# EasyEDA Pro project d2-afe-development.epro, board PCB1_1
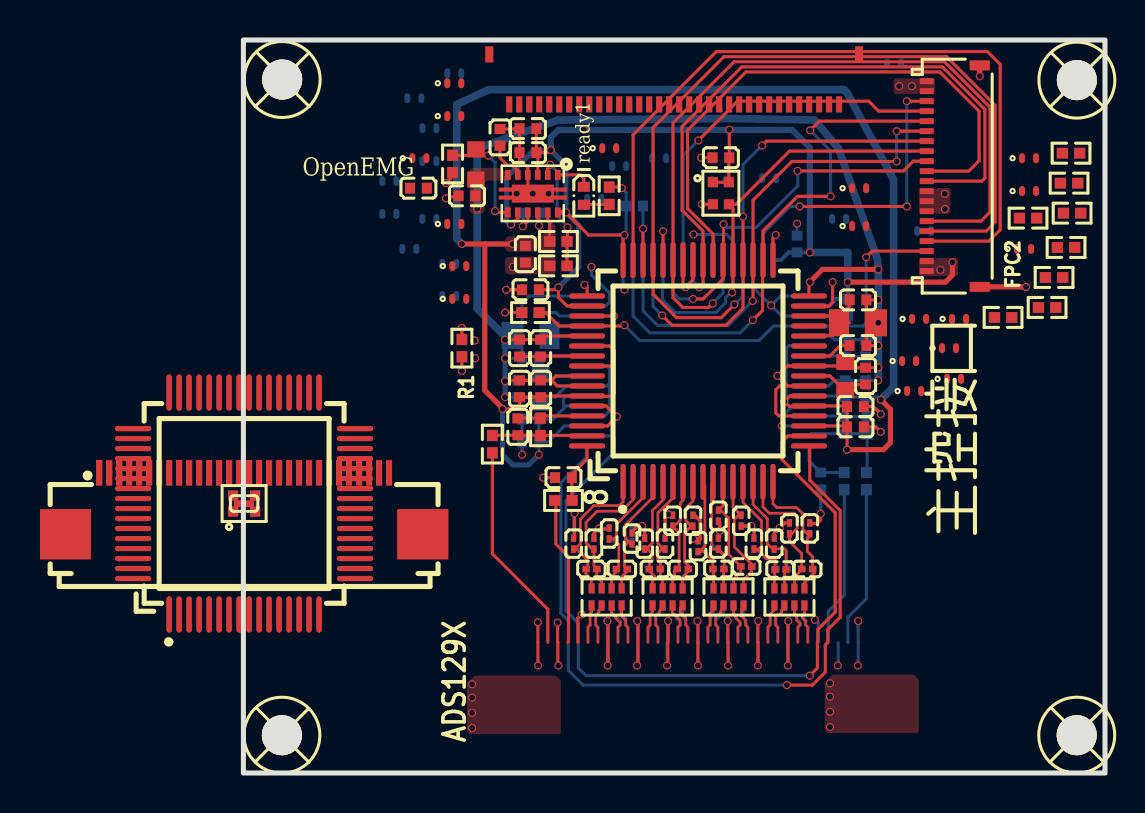
[diagram p2: board, top side]
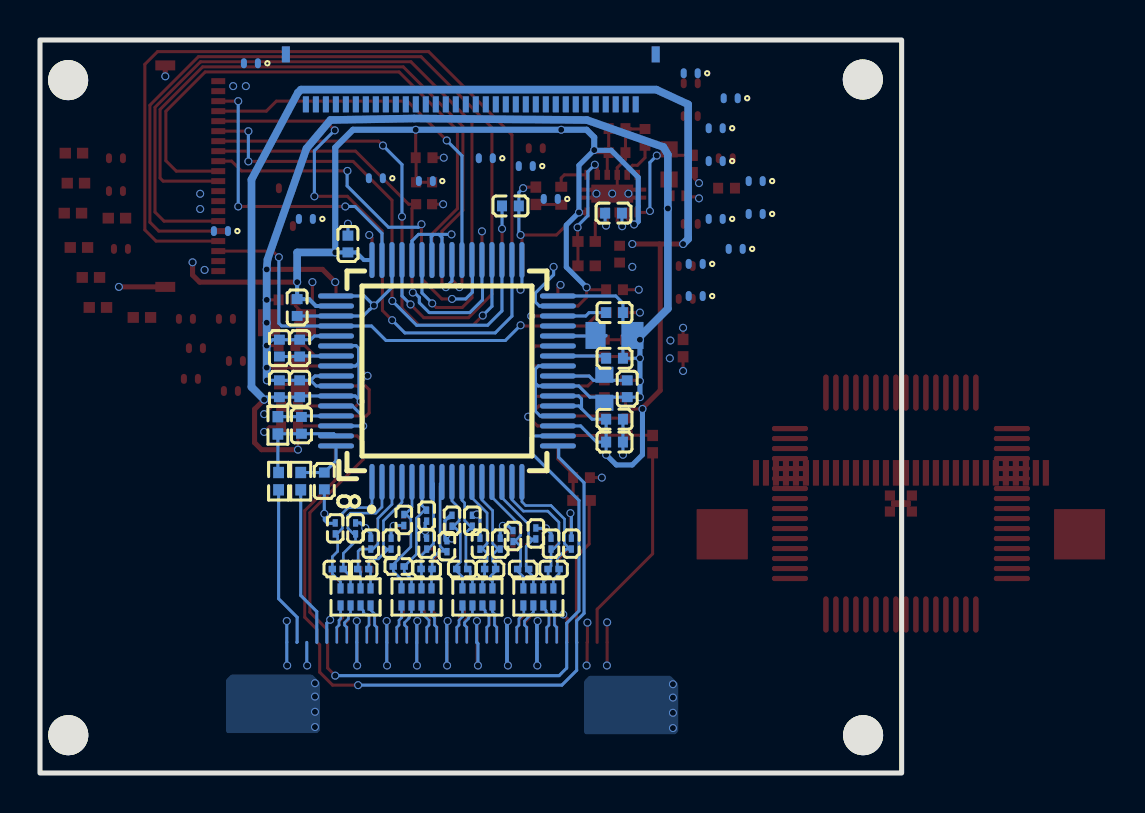
[diagram p3: board, bottom side, seen from below]

Outline 43.1 x 36.67 mm; copper layers: Top Layer, Inner1, Inner2, Bottom Layer. Coordinates in mm from the lower left corner of the outline.
Outline path: rectangle 0,36.67 43.1,0
Stack: Top Layer 0.035mm Outer layer thickness 1oz / Dielectric1 0.2104mm 7628 RC49% 8.6mil / Inner1 0.0152mm Inner layer thickness / Dielectric2 1.065mm 1.1mm H/HOZ Copper / Inner2 0.0152mm Inner layer thickness / Dielectric3 0.2104mm 7628 RC49% 8.6mil / Bottom Layer 0.035mm Outer layer thickness 1oz

## Design rules (mm)
net IN8N: DP1
net IN8P: DP1
net IN7N: DP2
net IN7P: DP2
net IN6N: DP3
net IN6P: DP3
net IN5N: DP4
net IN5P: DP4
net IN4N: DP5
net IN4P: DP5
net IN3N: DP6
net IN3P: DP6
net IN2P: DP7
net IN2N: DP7
net IN1N: DP8
net IN1P: DP8
net IN1P2: DP35
net IN1N2: DP35
net IN2P2: DP37
net IN2N2: DP37
net IN3P2: DP33
net IN3N2: DP33
net IN4P2: DP31
net IN4N2: DP31
net IN5P2: DP29
net IN5N2: DP29
net IN6P2: DP27
net IN6N2: DP27
net IN7P2: DP25
net IN7N2: DP25
net IN8P2: DP23
net IN8N2: DP23
spacing copperThickness1oz (default): track to track 0.102, other pairs 0.152 to 0.3
spacing copperThickness2oz: track to track 0.203, other pairs 0.152 to 0.3
spacing Copper_copperRegion: track to track 0.102, other pairs 0.152 to 0.3
spacing Plane_innerPlane: track to track 0.102, other pairs 0.152 to 0.3
track width copperThickness1oz (default): min 0.127, default 0.152, max 2.54
track width copperThickness2oz: min 0.203, default 0.254, max 2.54
differential pair differentialPair (default): width min 0.127, default 0.127, max 2.54; gap min 0.152, default 0.152
net +3.3V uses copperRegion_copperThickness1oz
net AGND uses copperRegion_copperThickness1oz
net -2.5V uses copperRegion_copperThickness1oz
net +2.5V uses copperRegion_copperThickness1oz
net GND uses copperRegion_copperThickness1oz
pour e1164 uses Copper_copperRegion, copperRegion_Copper_copperRegion
pour e1166 uses Copper_copperRegion, copperRegion_Copper_copperRegion
pour e1169 uses Copper_copperRegion, copperRegion_Copper_copperRegion
pour e1171 uses Copper_copperRegion, copperRegion_Copper_copperRegion
pour e1173 uses Copper_copperRegion, copperRegion_Copper_copperRegion
pour e1175 uses Copper_copperRegion, copperRegion_Copper_copperRegion
pour e1177 uses Copper_copperRegion, copperRegion_Copper_copperRegion
pour e1179 uses Copper_copperRegion, copperRegion_Copper_copperRegion
pour e1181 uses Copper_copperRegion, copperRegion_Copper_copperRegion
region e1678 uses Copper_copperRegion, copperRegion_Copper_copperRegion
pour e1686 uses Copper_copperRegion, copperRegion_Copper_copperRegion
pour e1905 uses Copper_copperRegion, copperRegion_Copper_copperRegion
pour e1908 uses Copper_copperRegion, copperRegion_Copper_copperRegion
pour e1930 uses Copper_copperRegion, copperRegion_Copper_copperRegion

## Placement (name value [footprint] x y rotation side)
C1  22uF  [C08A:V4_C54]  30.74 22.52 0 top
C2  22uF  [C08A:V4_C54]  14.36 21.89 180 bottom
C3  100nF  [C0402]  31.12 19.86 270 top
C4  10uF  [C08A:V4_C46]  30.11 19.86 270 top
C5  100nF  [C0402]  13.73 19.22 90 bottom
C6  2.2uF  [C0402]  14.11 25.95 270 top
C7  2.2uF  [C0402]  11.19 28.87 180 top
C8  100nF  [C0402]  14.23 32.23 0 top
C9  10uF  [C0402]  14.23 31.03 180 top
C10  100nF  [C0402]  14.41 28 180 bottom
C11  4.7uF  [C0402]  12.84 31.79 270 top
C12  1uF  [C0402]  30.74 21.38 0 top
C13  1uF  [C0402]  30.74 23.67 0 top
C14  10nF  [C0402]  13.73 17.32 270 top
C15  1uF  [C0402]  14.36 20.75 180 bottom
C16  1uF  [C0402]  14.36 23.03 180 bottom
C17  10nF  [C0402]  30.02 17.39 270 bottom
C18  100nF  [C0402]  30.11 21.25 270 bottom
C19  1uF  [C0402]  31.12 21.25 270 bottom
C20  1uF  [C0402]  13.81 21.25 270 top
C21  100nF  [C0402]  14.87 21.25 270 top
C22  100nF  [C0402]  14.36 24.17 180 top
C23  1uF  [C0402]  19.57 28.36 0 bottom
C24  100nF  [C0402]  30.62 17.32 0 top
C25  1uF  [C0402]  30.62 18.33 0 top
C26  100nF  [C0402]  14.87 19.22 90 top
C27  1uF  [C0402]  13.81 19.22 90 top
C28  100nF  [C0402]  27.7 26.46 90 bottom
C29  1uF  [C0402]  30.24 23.28 270 bottom
C30  100nF  [C0402]  14.36 16.55 180 bottom
C31  1uF  [C0402]  14.36 17.7 180 bottom
C32  100nF  [C0402]  30.11 19.22 90 bottom
C33  1uF  [C0402]  31.12 19.22 90 bottom
C34  10uF  [C08A:V4_C46]  14.87 19.22 90 bottom
C37  100nF  [C0402]  23.89 30.78 0 top
C55  470pF  [C0201]  28.33 12.24 270 top
C57  470pF  [C0201]  27.31 12.24 270 top
C58  470pF  [C0201]  26.55 11.47 270 top
C59  470pF  [C0201]  25.54 11.47 270 top
C60  470pF  [C0201]  24.9 12.62 90 top
C61  470pF  [C0201]  23.76 12.87 90 top
C62  470pF  [C0201]  23.76 11.47 270 top
C63  470pF  [C0201]  22.74 11.35 270 top
C64  470pF  [C0201]  22.49 12.62 270 top
C65  470pF  [C0201]  21.47 12.62 270 top
C66  470pF  [C0201]  21.09 11.47 270 top
C67  470pF  [C0201]  20.08 11.47 270 top
C68  470pF  [C0201]  19.44 11.73 270 top
C69  470pF  [C0201]  18.3 11.98 270 top
C70  470pF  [C0201]  17.54 11.47 270 top
C71  470pF  [C0201]  16.52 11.47 270 top
C72  100pF  [C0201#2]  28.2 10.2 0 top
C73  100pF  [C0201#2]  26.87 10.18 0 top
C74  100pF  [C0201#2]  25.16 10.33 0 top
C75  100pF  [C0201#2]  23.76 10.2 0 top
C76  100pF  [C0201#2]  21.98 10.2 0 top
C77  100pF  [C0201#2]  20.58 10.2 0 top
C78  100pF  [C0201#2]  18.93 10.2 0 top
C79  100pF  [C0201#2]  17.41 10.2 0 top
C93  470pF  [C0201]  16.52 11.47 270 bottom
C94  470pF  [C0201]  17.54 11.47 270 bottom
C95  470pF  [C0201]  18.3 11.98 270 bottom
C96  470pF  [C0201]  19.44 11.86 270 bottom
C97  470pF  [C0201]  20.08 11.47 270 bottom
C98  470pF  [C0201]  21.09 11.47 270 bottom
C99  470pF  [C0201]  21.47 12.62 270 bottom
C100  470pF  [C0201]  22.49 12.62 270 bottom
C101  470pF  [C0201]  22.74 11.35 270 bottom
C102  470pF  [C0201]  23.76 11.47 270 bottom
C103  470pF  [C0201]  23.76 12.87 90 bottom
C104  470pF  [C0201]  24.9 12.66 90 bottom
C105  470pF  [C0201]  25.54 11.47 270 bottom
C106  470pF  [C0201]  26.55 11.47 270 bottom
C107  470pF  [C0201]  27.31 12.24 270 bottom
C108  470pF  [C0201]  28.33 12.24 270 bottom
C109  100pF  [C0201#2]  17.41 10.2 180 bottom
C110  100pF  [C0201#2]  18.93 10.2 180 bottom
C111  100pF  [C0201#2]  20.58 10.2 180 bottom
C112  100pF  [C0201#2]  21.98 10.2 180 bottom
C113  100pF  [C0201#2]  23.76 10.2 180 bottom
C114  100pF  [C0201#2]  25.16 10.33 180 bottom
C115  100pF  [C0201#2]  26.93 10.2 180 bottom
C116  100pF  [C0201#2]  28.2 10.2 180 bottom
C123  100pF  [C0402]  16.01 14.78 180 top
C124  100pF  [C0402]  28.88 14.61 270 bottom
C138  100nF  [C0402]  8.76 29.26 0 top
D910  ESD401DPYR  [C08A:D910]  18.3 31.25 0 top
D911  ESD401DPYR  [C08A:D910]  10.55 32.86 0 top
D912  ESD401DPYR  [C08A:D910]  10.55 27.47 0 top
D913  ESD401DPYR  [C08A:D910]  10.55 34.5 0 top
D914  ESD401DPYR  [C08A:D910]  10.8 25.36 0 top
D915  ESD401DPYR  [C08A:D910]  10.8 23.72 0 top
D916  ESD401DPYR  [C08A:D910]  30.8 29.25 0 top
D917  ESD401DPYR  [C08A:D910]  30.8 27.36 0 top
D918  ESD401DPYR  [C08A:D910]  33.8 22.72 0 top
D919  ESD401DPYR  [C08A:D910]  8.8 30.75 0 top
D920  ESD401DPYR  [C08A:D910]  33.3 20.61 0 top
D921  ESD401DPYR  [C08A:D910]  35.8 22.72 0 top
D922  ESD401DPYR  [C08A:D910]  35.3 21.25 0 top
D923  ESD401DPYR  [C08A:D910]  33.55 19.11 0 top
D924  ESD401DPYR  [C08A:D910]  35.55 19.72 0 top
D925  ESD401DPYR  [C08A:D910]  39.3 30.75 0 top
D926  ESD401DPYR  [C08A:D910]  39.3 29.11 0 top
D927  ESD401DPYR  [C08A:D910]  39.05 26.22 0 top
D930  ESD401DPYR  [C08A:D910]  26.3 29.75 0 bottom
D931  ESD401DPYR  [C08A:D910]  23.8 29.61 0 bottom
D932  ESD401DPYR  [C08A:D910]  29.8 27.72 0 bottom
D933  ESD401DPYR  [C08A:D910]  20.8 30.75 0 bottom
D934  ESD401DPYR  [C08A:D910]  18.8 30.36 0 bottom
D935  ESD401DPYR  [C08A:D910]  17.55 28.72 0 bottom
D936  ESD401DPYR  [C08A:D910]  32.55 35.5 0 bottom
D937  ESD401DPYR  [C08A:D910]  34.05 27.11 0 bottom
D938  ESD401DPYR  [C08A:D910]  10.3 25.47 0 bottom
D939  ESD401DPYR  [C08A:D910]  10.55 35 0 bottom
D940  ESD401DPYR  [C08A:D910]  9.3 30.61 0 bottom
D941  ESD401DPYR  [C08A:D910]  9.3 27.72 0 bottom
D942  ESD401DPYR  [C08A:D910]  9.3 32.25 0 bottom
D943  ESD401DPYR  [C08A:D910]  10.3 23.86 0 bottom
D944  ESD401DPYR  [C08A:D910]  8.3 26.22 0 bottom
D945  ESD401DPYR  [C08A:D910]  8.55 33.75 0 bottom
D946  ESD401DPYR  [C08A:D910]  7.3 29.61 0 bottom
D947  ESD401DPYR  [C08A:D910]  7.3 27.97 0 bottom
FPC1  FH34SRJ-34S-0.5SH(50)  [Hirose_FH34SRJ-34S-0.5SH]  21.55 33.45 180 top
FPC2  5034802000  [FPC-SMD_5034802000]  35.51 29.86 90 top
FPC3  FH34SRJ-34S-0.5SH(50)  [Hirose_FH34SRJ-34S-0.5SH]  21.55 33.45 0 bottom
LM1  LM27762DSSR  [WSON-12_L3.0-W2.0-P0.50-BL-EP]  14.48 28.98 180 top
NOREF  -  [Pad_e71]  -1.21 15.02 0 top
NOREF#2  -  [Pad_e53]  -8.9 11.94 0 top
NOREF#3  -  [Pad_e196]  5.59 9.73 0 top
NOREF#4  -  [Pad_e22]  -0.24 13.48 0 top
NOREF#5  -  [Pad_e21]  0.31 13.48 0 top
NOREF#6  -  [Pad_e78]  -4.71 15.02 0 top
NOREF#7  -  [Pad_e188]  5.59 13.73 0 top
NOREF#8  -  [Pad_e183]  5.59 16.23 0 top
NOREF#9  -  [Pad_e209]  -2.21 7.93 0 top
NOREF#10  -  [Pad_e59]  4.79 15.02 0 top
NOREF#11  -  [Pad_e194]  5.59 10.73 0 top
NOREF#12  -  [Pad_e170]  -1.21 19.03 0 top
NOREF#13  -  [Pad_e176]  1.79 19.03 0 top
NOREF#14  -  [Pad_e21]  0.31 13.48 0 top
NOREF#15  -  [Pad_e67]  0.79 15.02 0 top
NOREF#16  -  [Pad_e16]  0.59 13.08 0 top
NOREF#17  -  [Pad_e66]  1.29 15.02 0 top
NOREF#18  -  [Pad_e174]  0.79 19.03 0 top
NOREF#19  -  [Pad_e202]  1.29 7.93 0 top
NOREF#20  -  [Pad_e201]  1.79 7.93 0 top
NOREF#21  -  [Pad_e208]  -1.71 7.93 0 top
NOREF#22  -  [Pad_e82]  -6.71 15.02 0 top
NOREF#23  -  [Pad_e22]  -0.24 13.48 0 top
NOREF#24  -  [Pad_e21]  0.31 13.48 0 top
NOREF#25  -  [Pad_e22]  -0.24 13.48 0 top
NOREF#26  -  [Pad_e21]  0.31 13.48 0 top
NOREF#27  -  [Pad_e68]  0.29 15.02 0 top
NOREF#28  -  [Pad_e193]  5.59 11.23 0 top
NOREF#29  -  [Pad_e17]  0.59 13.88 0 top
NOREF#30  -  [Pad_e21]  0.31 13.48 0 top
NOREF#31  -  [Pad_e22]  -0.24 13.48 0 top
NOREF#32  -  [Pad_e159]  -5.51 14.73 0 top
NOREF#33  -  [Pad_e203]  0.79 7.93 0 top
NOREF#34  -  [Pad_e22]  -0.24 13.48 0 top
NOREF#35  -  [Pad_e21]  0.31 13.48 0 top
NOREF#36  -  [Pad_e21]  0.31 13.48 0 top
NOREF#37  -  [Pad_e21]  0.31 13.48 0 top
NOREF#38  -  [Pad_e22]  -0.24 13.48 0 top
NOREF#39  -  [Pad_e152]  -5.51 11.23 0 top
NOREF#40  -  [Pad_e82]  -6.71 15.02 0 top
NOREF#41  -  [Pad_e166]  -3.21 19.03 0 top
NOREF#42  -  [Pad_e22]  -0.24 13.48 0 top
NOREF#43  -  [Pad_e190]  5.59 12.73 0 top
NOREF#44  -  [Pad_e22]  -0.24 13.48 0 top
NOREF#45  -  [Pad_e180]  3.79 19.03 0 top
NOREF#46  -  [Pad_e22]  -0.24 13.48 0 top
NOREF#47  -  [Pad_e197]  3.79 7.93 0 top
NOREF#48  -  [Pad_e78]  -4.71 15.02 0 top
NOREF#49  -  [Pad_e175]  1.29 19.03 0 top
NOREF#50  -  [Pad_e180]  3.79 19.03 0 top
NOREF#51  -  [Pad_e21]  0.31 13.48 0 top
NOREF#52  -  [Pad_e187]  5.59 14.23 0 top
NOREF#53  -  [Pad_e149]  -5.51 9.73 0 top
NOREF#54  -  [Pad_e191]  5.59 12.23 0 top
NOREF#55  -  [Pad_e166]  -3.21 19.03 0 top
NOREF#56  -  [Pad_e59]  4.79 15.02 0 top
NOREF#57  -  [Pad_e21]  0.31 13.48 0 top
NOREF#58  -  [Pad_e184]  5.59 15.73 0 top
NOREF#59  -  [Pad_e21]  0.31 13.48 0 top
NOREF#60  -  [Pad_e75]  -3.21 15.02 0 top
NOREF#61  -  [Pad_e74]  -2.71 15.02 0 top
NOREF#62  -  [Pad_e212]  -3.71 7.93 0 top
NOREF#63  -  [Pad_e190]  5.59 12.73 0 top
NOREF#64  -  [Pad_e205]  -0.21 7.93 0 top
NOREF#65  -  [Pad_e177]  2.29 19.03 0 top
NOREF#66  -  [Pad_e22]  -0.24 13.48 0 top
NOREF#67  -  [Pad_e22]  -0.24 13.48 0 top
NOREF#68  -  [Pad_e211]  -3.21 7.93 0 top
NOREF#69  -  [Pad_e18]  -0.51 13.88 0 top
NOREF#70  -  [Pad_e80]  -5.71 15.02 0 top
NOREF#71  -  [Pad_e154]  -5.51 12.23 0 top
NOREF#72  -  [Pad_e160]  -5.51 15.23 0 top
NOREF#73  -  [Pad_e156]  -5.51 13.23 0 top
NOREF#74  -  [Pad_e58]  5.29 15.02 0 top
NOREF#75  -  [Pad_e167]  -2.71 19.03 0 top
NOREF#76  -  [Pad_e54]  7.29 15.02 0 top
NOREF#77  -  [Pad_e56]  6.29 15.02 0 top
NOREF#78  -  [Pad_e152]  -5.51 11.23 0 top
NOREF#79  -  [Pad_e62]  3.29 15.02 0 top
NOREF#80  -  [Pad_e21]  0.31 13.48 0 top
NOREF#81  -  [Pad_e22]  -0.24 13.48 0 top
NOREF#82  -  [Pad_e53]  -8.9 11.94 0 top
NOREF#83  -  [Pad_e64]  2.29 15.02 0 top
NOREF#84  -  [Pad_e80]  -5.71 15.02 0 top
NOREF#85  -  [Pad_e198]  3.29 7.93 0 top
NOREF#86  -  [Pad_e22]  -0.24 13.48 0 top
NOREF#87  -  [Pad_e181]  5.59 17.23 0 top
NOREF#88  -  [Pad_e57]  5.79 15.02 0 top
NOREF#89  -  [Pad_e201]  1.79 7.93 0 top
NOREF#90  -  [Pad_e81]  -6.21 15.02 0 top
NOREF#91  -  [Pad_e21]  0.31 13.48 0 top
NOREF#92  -  [Pad_e21]  0.31 13.48 0 top
NOREF#93  -  [Pad_e189]  5.59 13.23 0 top
NOREF#94  -  [Pad_e182]  5.59 16.73 0 top
NOREF#95  -  [Pad_e192]  5.59 11.73 0 top
NOREF#96  -  [Pad_e70]  -0.71 15.02 0 top
NOREF#97  -  [Pad_e154]  -5.51 12.23 0 top
NOREF#98  -  [Pad_e22]  -0.24 13.48 0 top
NOREF#99  -  [Pad_e196]  5.59 9.73 0 top
NOREF#100  -  [Pad_e22]  -0.24 13.48 0 top
NOREF#101  -  [Pad_e75]  -3.21 15.02 0 top
NOREF#102  -  [Pad_e66]  1.29 15.02 0 top
NOREF#103  -  [Pad_e69]  -0.21 15.02 0 top
NOREF#104  -  [Pad_e171]  -0.71 19.03 0 top
NOREF#105  -  [Pad_e76]  -3.71 15.02 0 top
NOREF#106  -  [Pad_e164]  -5.51 17.23 0 top
NOREF#107  -  [Pad_e204]  0.29 7.93 0 top
NOREF#108  -  [Pad_e56]  6.29 15.02 0 top
NOREF#109  -  [Pad_e155]  -5.51 12.73 0 top
NOREF#110  -  [Pad_e22]  -0.24 13.48 0 top
NOREF#111  -  [Pad_e65]  1.79 15.02 0 top
NOREF#112  -  [Pad_e63]  2.79 15.02 0 top
NOREF#113  -  [Pad_e183]  5.59 16.23 0 top
NOREF#114  -  [Pad_e22]  -0.24 13.48 0 top
NOREF#115  -  [Pad_e21]  0.31 13.48 0 top
NOREF#116  -  [Pad_e72]  -1.71 15.02 0 top
NOREF#117  -  [Pad_e173]  0.29 19.03 0 top
NOREF#118  -  [Pad_e21]  0.31 13.48 0 top
NOREF#119  -  [Pad_e21]  0.31 13.48 0 top
NOREF#120  -  [Pad_e207]  -1.21 7.93 0 top
NOREF#121  -  [Pad_e74]  -2.71 15.02 0 top
NOREF#122  -  [Pad_e21]  0.31 13.48 0 top
NOREF#123  -  [Pad_e205]  -0.21 7.93 0 top
NOREF#124  -  [Pad_e206]  -0.71 7.93 0 top
NOREF#125  -  [Pad_e21]  0.31 13.48 0 top
NOREF#126  -  [Pad_e21]  0.31 13.48 0 top
NOREF#127  -  [Pad_e157]  -5.51 13.73 0 top
NOREF#128  -  [Pad_e149]  -5.51 9.73 0 top
NOREF#129  -  [Pad_e198]  3.29 7.93 0 top
NOREF#130  -  [Pad_e178]  2.79 19.03 0 top
NOREF#131  -  [Pad_e55]  6.79 15.02 0 top
NOREF#132  -  [Pad_e64]  2.29 15.02 0 top
NOREF#133  -  [Pad_e21]  0.31 13.48 0 top
NOREF#134  -  [Pad_e22]  -0.24 13.48 0 top
NOREF#135  -  [Pad_e157]  -5.51 13.73 0 top
NOREF#136  -  [Pad_e169]  -1.71 19.03 0 top
NOREF#137  -  [Pad_e21]  0.31 13.48 0 top
NOREF#138  -  [Pad_e55]  6.79 15.02 0 top
NOREF#139  -  [Pad_e182]  5.59 16.73 0 top
NOREF#140  -  [Pad_e212]  -3.71 7.93 0 top
NOREF#141  -  [Pad_e172]  -0.21 19.03 0 top
NOREF#142  -  [Pad_e199]  2.79 7.93 0 top
NOREF#143  -  [Pad_e155]  -5.51 12.73 0 top
NOREF#144  -  [Pad_e186]  5.59 14.73 0 top
NOREF#145  -  [Pad_e169]  -1.71 19.03 0 top
NOREF#146  -  [Pad_e203]  0.79 7.93 0 top
NOREF#147  -  [Pad_e71]  -1.21 15.02 0 top
NOREF#148  -  [Pad_e22]  -0.24 13.48 0 top
NOREF#149  -  [Pad_e185]  5.59 15.23 0 top
NOREF#150  -  [Pad_e22]  -0.24 13.48 0 top
NOREF#151  -  [Pad_e72]  -1.71 15.02 0 top
NOREF#152  -  [Pad_e21]  0.31 13.48 0 top
NOREF#153  -  [Pad_e199]  2.79 7.93 0 top
NOREF#154  -  [Pad_e162]  -5.51 16.23 0 top
NOREF#155  -  [Pad_e163]  -5.51 16.73 0 top
NOREF#156  -  [Pad_e22]  -0.24 13.48 0 top
NOREF#157  -  [Pad_e21]  0.31 13.48 0 top
NOREF#158  -  [Pad_e165]  -3.71 19.03 0 top
NOREF#159  -  [Pad_e210]  -2.71 7.93 0 top
NOREF#160  -  [Pad_e186]  5.59 14.73 0 top
NOREF#161  -  [Pad_e191]  5.59 12.23 0 top
NOREF#162  -  [Pad_e60]  4.29 15.02 0 top
NOREF#163  -  [Pad_e179]  3.29 19.03 0 top
NOREF#164  -  [Pad_e202]  1.29 7.93 0 top
NOREF#165  -  [Pad_e193]  5.59 11.23 0 top
NOREF#166  -  [Pad_e161]  -5.51 15.73 0 top
NOREF#167  -  [Pad_e22]  -0.24 13.48 0 top
NOREF#168  -  [Pad_e174]  0.79 19.03 0 top
NOREF#169  -  [Pad_e211]  -3.21 7.93 0 top
NOREF#170  -  [Pad_e168]  -2.21 19.03 0 top
NOREF#171  -  [Pad_e162]  -5.51 16.23 0 top
NOREF#172  -  [Pad_e207]  -1.21 7.93 0 top
NOREF#173  -  [Pad_e179]  3.29 19.03 0 top
NOREF#174  -  [Pad_e210]  -2.71 7.93 0 top
NOREF#175  -  [Pad_e187]  5.59 14.23 0 top
NOREF#176  -  [Pad_e156]  -5.51 13.23 0 top
NOREF#177  -  [Pad_e21]  0.31 13.48 0 top
NOREF#178  -  [Pad_e165]  -3.71 19.03 0 top
NOREF#179  -  [Pad_e22]  -0.24 13.48 0 top
NOREF#180  -  [Pad_e79]  -5.21 15.02 0 top
NOREF#181  -  [Pad_e171]  -0.71 19.03 0 top
NOREF#182  -  [Pad_e194]  5.59 10.73 0 top
NOREF#183  -  [Pad_e209]  -2.21 7.93 0 top
NOREF#184  -  [Pad_e60]  4.29 15.02 0 top
NOREF#185  -  [Pad_e181]  5.59 17.23 0 top
NOREF#186  -  [Pad_e21]  0.31 13.48 0 top
NOREF#187  -  [Pad_e61]  3.79 15.02 0 top
NOREF#188  -  [Pad_e81]  -6.21 15.02 0 top
NOREF#189  -  [Pad_e21]  0.31 13.48 0 top
NOREF#190  -  [Pad_e65]  1.79 15.02 0 top
NOREF#191  -  [Pad_e185]  5.59 15.23 0 top
NOREF#192  -  [Pad_e73]  -2.21 15.02 0 top
NOREF#193  -  [Pad_e83]  -7.21 15.02 0 top
NOREF#194  -  [Pad_e62]  3.29 15.02 0 top
NOREF#195  -  [Pad_e21]  0.31 13.48 0 top
NOREF#196  -  [Pad_e176]  1.79 19.03 0 top
NOREF#197  -  [Pad_e184]  5.59 15.73 0 top
NOREF#198  -  [Pad_e163]  -5.51 16.73 0 top
NOREF#199  -  [Pad_e200]  2.29 7.93 0 top
NOREF#200  -  [Pad_e21]  0.31 13.48 0 top
NOREF#201  -  [Pad_e21]  0.31 13.48 0 top
NOREF#202  -  [Pad_e195]  5.59 10.23 0 top
NOREF#203  -  [Pad_e178]  2.79 19.03 0 top
NOREF#204  -  [Pad_e192]  5.59 11.73 0 top
NOREF#205  -  [Pad_e200]  2.29 7.93 0 top
NOREF#206  -  [Pad_e22]  -0.24 13.48 0 top
NOREF#207  -  [Pad_e168]  -2.21 19.03 0 top
NOREF#208  -  [Pad_e189]  5.59 13.23 0 top
NOREF#209  -  [Pad_e153]  -5.51 11.73 0 top
NOREF#210  -  [Pad_e61]  3.79 15.02 0 top
NOREF#211  -  [Pad_e52]  8.98 11.94 0 top
NOREF#212  -  [Pad_e83]  -7.21 15.02 0 top
NOREF#213  -  [Pad_e175]  1.29 19.03 0 top
NOREF#214  -  [Pad_e22]  -0.24 13.48 0 top
NOREF#215  -  [Pad_e208]  -1.71 7.93 0 top
NOREF#216  -  [Pad_e15]  -0.51 13.08 0 top
NOREF#217  -  [Pad_e159]  -5.51 14.73 0 top
NOREF#218  -  [Pad_e21]  0.31 13.48 0 top
NOREF#219  -  [Pad_e57]  5.79 15.02 0 top
NOREF#220  -  [Pad_e167]  -2.71 19.03 0 top
NOREF#221  -  [Pad_e151]  -5.51 10.73 0 top
NOREF#222  -  [Pad_e67]  0.79 15.02 0 top
NOREF#223  -  [Pad_e69]  -0.21 15.02 0 top
NOREF#224  -  [Pad_e150]  -5.51 10.23 0 top
NOREF#225  -  [Pad_e22]  -0.24 13.48 0 top
NOREF#226  -  [Pad_e158]  -5.51 14.23 0 top
NOREF#227  -  [Pad_e151]  -5.51 10.73 0 top
NOREF#228  -  [Pad_e195]  5.59 10.23 0 top
NOREF#229  -  [Pad_e79]  -5.21 15.02 0 top
NOREF#230  -  [Pad_e172]  -0.21 19.03 0 top
NOREF#231  -  [Pad_e22]  -0.24 13.48 0 top
NOREF#232  -  [Pad_e21]  0.31 13.48 0 top
NOREF#233  -  [Pad_e173]  0.29 19.03 0 top
NOREF#234  -  [Pad_e22]  -0.24 13.48 0 top
NOREF#235  -  [Pad_e21]  0.31 13.48 0 top
NOREF#236  -  [Pad_e68]  0.29 15.02 0 top
NOREF#237  -  [Pad_e22]  -0.24 13.48 0 top
NOREF#238  -  [Pad_e206]  -0.71 7.93 0 top
NOREF#239  -  [Pad_e70]  -0.71 15.02 0 top
NOREF#240  -  [Pad_e153]  -5.51 11.73 0 top
NOREF#241  -  [Pad_e77]  -4.21 15.02 0 top
NOREF#242  -  [Pad_e73]  -2.21 15.02 0 top
NOREF#243  -  [Pad_e177]  2.29 19.03 0 top
NOREF#244  -  [Pad_e22]  -0.24 13.48 0 top
NOREF#245  -  [Pad_e188]  5.59 13.73 0 top
NOREF#246  -  [Pad_e52]  8.98 11.94 0 top
NOREF#247  -  [Pad_e58]  5.29 15.02 0 top
NOREF#248  -  [Pad_e158]  -5.51 14.23 0 top
NOREF#249  -  [Pad_e164]  -5.51 17.23 0 top
NOREF#250  -  [Pad_e22]  -0.24 13.48 0 top
NOREF#251  -  [Pad_e63]  2.79 15.02 0 top
NOREF#252  -  [Pad_e22]  -0.24 13.48 0 top
NOREF#253  -  [Pad_e170]  -1.21 19.03 0 top
NOREF#254  -  [Pad_e22]  -0.24 13.48 0 top
NOREF#255  -  [Pad_e204]  0.29 7.93 0 top
NOREF#256  -  [Pad_e160]  -5.51 15.23 0 top
NOREF#257  -  [Pad_e161]  -5.51 15.73 0 top
NOREF#258  -  [Pad_e76]  -3.71 15.02 0 top
NOREF#259  -  [Pad_e150]  -5.51 10.23 0 top
NOREF#260  -  [Pad_e77]  -4.21 15.02 0 top
NOREF#261  -  [Pad_e197]  3.79 7.93 0 top
NOREF#262  -  [Pad_e54]  7.29 15.02 0 top
R1  0Ω  [R0402]  10.93 21.25 90 top
R3  100kΩ  [R0402]  15.76 25.37 0 top
R4  104kΩ  [C08A:V4_R29]  11.63 30.44 270 top
R5  100kΩ  [R0402]  10.46 30.46 90 top
R6  107kΩ  [R0402]  15.76 26.59 180 top
R17  10kΩ  [R0402]  14.36 23.03 0 top
R24  392kΩ  [R0402]  14.87 17.32 270 top
R32  392kΩ  [R0402]  31.2 17.39 270 bottom
R34  392kΩ  [R0402]  12.46 16.45 270 top
R35  10kΩ  [R0402]  16.01 13.63 180 top
R36  392kΩ  [R0402]  31.16 14.6 270 bottom
R37  10kΩ  [R0402]  30.06 14.6 270 bottom
R801  10kΩ  [R0402]  39.25 27.76 0 top
R802  10kΩ  [R0402]  41.4 31.01 0 top
R803  10kΩ  [R0402]  41.3 29.51 0 top
R804  10kΩ  [R0402]  41.45 28.01 0 top
R805  10kΩ  [R0402]  38 22.79 0 top
R806  10kΩ  [R0402]  41.15 26.29 0 top
R807  10kΩ  [R0402]  40.55 24.79 0 top
R808  10kΩ  [R0402]  40.2 23.29 0 top
R_pu1  10kΩ  [R0402]  18.3 28.87 270 top
ready1  XL-1005UGC  [LED0402-RD_GREEN-1]  17.03 28.87 270 top
SCREW1  -  [M2螺丝]  1.94 34.69 0 top
SCREW2  -  [M2螺丝]  1.93 1.89 0 top
SCREW3  -  [M2螺丝]  41.69 1.89 0 top
SCREW4  -  [M2螺丝]  41.69 34.66 0 top
U1  ADS1298IPAGR  [TQFP-64_L10.0-W10.0-P0.50-LS12.0-BL]  22.74 20.11 0 top
U2  ADS1298IPAGR  [TQFP-64_L10.0-W10.0-P0.50-LS12.0-BL]  22.74 20.11 180 bottom
U3  15kΩ  [RES-ARRAY-SMD_0402-8P-L2.0-W1.0-BL]  18.17 8.81 180 top
U4  15kΩ  [RES-ARRAY-SMD_0402-8P-L2.0-W1.0-BL]  21.22 8.81 180 top
U5  15kΩ  [RES-ARRAY-SMD_0402-8P-L2.0-W1.0-BL]  24.27 8.81 180 top
U6  15kΩ  [RES-ARRAY-SMD_0402-8P-L2.0-W1.0-BL]  27.31 8.81 180 top
U7  15kΩ  [RES-ARRAY-SMD_0402-8P-L2.0-W1.0-BL]  27.31 8.81 0 bottom
U8  15kΩ  [RES-ARRAY-SMD_0402-8P-L2.0-W1.0-BL]  24.27 8.81 0 bottom
U9  15kΩ  [RES-ARRAY-SMD_0402-8P-L2.0-W1.0-BL]  21.22 8.81 0 bottom
U10  15kΩ  [RES-ARRAY-SMD_0402-8P-L2.0-W1.0-BL]  18.17 8.81 0 bottom
X1  2.048MHz  [OSC-SMD_4P-L1.6-W1.2-BL]  23.89 29 270 top

## Footprints (pads in the part's own frame, mm; a bottom-side part is the same pattern mirrored in y, then rotated)
C08A:D910
  rrect 0.3x0.5 smd: 1(-0.35,0) 2(0.35,0)
C08A:V4_C46
  rect 0.8x0.9 smd: 1(-0.7,0) 2(0.7,0)
C08A:V4_C54
  rect 1x1.35 smd: 1(-0.95,0) 2(0.95,0)
C08A:V4_R29
  rect 0.806x0.864 smd: 1(-0.753,0) 2(0.753,0)
C0201
  rect 0.368x0.254 smd: 1(-0.275,0) 2(0.275,0)
C0201#2
  rect 0.368x0.325 smd: 1(-0.275,0) 2(0.275,0)
C0402
  rect 0.5x0.54 smd: 1(-0.42,0) 2(0.42,0)
FPC-SMD_5034802000
  rect 0.3x0.7 smd: 1(-4.75,1.325) 2(-4.25,1.325) 3(-3.75,1.325) 4(-3.25,1.325) 5(-2.75,1.325) 6(-2.25,1.325) 7(-1.75,1.325) 8(-1.25,1.325) 9(-0.75,1.325) 10(-0.25,1.325) 11(0.25,1.325) 12(0.75,1.325) 13(1.25,1.325) 14(1.75,1.325) 15(2.25,1.325) 16(2.75,1.325) 17(3.25,1.325) 18(3.75,1.325) 19(4.25,1.325) 20(4.75,1.325)
  rect 0.5x1 smd: 21(5.54,-1.325) 22(-5.54,-1.325)
Hirose_FH34SRJ-34S-0.5SH
  rect 0.3x0.8 smd: 1(8.25,0) 2(7.75,0) 3(7.25,0) 4(6.75,0) 5(6.25,0) 6(5.75,0) 7(5.25,0) 8(4.75,0) 9(4.25,0) 10(3.75,0) 11(3.25,0) 12(2.75,0) 13(2.25,0) 14(1.75,0) 15(1.25,0) 16(0.75,0) 17(0.25,0) 18(-0.25,0) 19(-0.75,0) 20(-1.25,0) 21(-1.75,0) 22(-2.25,0) 23(-2.75,0) 24(-3.25,0) 25(-3.75,0) 26(-4.25,0) 27(-4.75,0) 28(-5.25,0) 29(-5.75,0) 30(-6.25,0) 31(-6.75,0) 32(-7.25,0) 33(-7.75,0) 34(-8.25,0)
  rect 0.4x0.8 smd: MP(-9.25,-2.5) MP(9.25,-2.5)
LED0402-RD_GREEN-1
  rect 0.5x0.6 smd: 1(-0.45,0) 2(0.45,0)
M2螺丝
  round 2 hole 2: 1(0,0)
OSC-SMD_4P-L1.6-W1.2-BL
  rect 0.508x0.508 smd: 1(-0.55,-0.4) 2(0.55,-0.4) 3(0.55,0.4) 4(-0.55,0.4)
Pad_e15
  rect 0.508x0.508 smd: 1(0,0)
Pad_e16
  rect 0.508x0.508 smd: 2(0,0)
Pad_e17
  rect 0.508x0.508 smd: 3(0,0)
Pad_e18
  rect 0.508x0.508 smd: 4(0,0)
Pad_e21
  rect 0.368x0.254 smd: 2(0,0)
Pad_e22
  rect 0.368x0.254 smd: 1(0,0)
Pad_e52
  rect 2.54x2.5 smd: 31(0,0)
Pad_e53
  rect 2.54x2.5 smd: 32(0,0)
Pad_e54
  rect 0.299x1.27 smd: 30(0,0)
Pad_e55
  rect 0.299x1.27 smd: 29(0,0)
Pad_e56
  rect 0.299x1.27 smd: 28(0,0)
Pad_e57
  rect 0.299x1.25 smd: 27(0,0)
Pad_e58
  rect 0.299x1.27 smd: 26(0,0)
Pad_e59
  rect 0.299x1.25 smd: 25(0,0)
Pad_e60
  rect 0.299x1.25 smd: 24(0,0)
Pad_e61
  rect 0.299x1.25 smd: 23(0,0)
Pad_e62
  rect 0.299x1.25 smd: 22(0,0)
Pad_e63
  rect 0.299x1.27 smd: 21(0,0)
Pad_e64
  rect 0.299x1.27 smd: 20(0,0)
Pad_e65
  rect 0.299x1.27 smd: 19(0,0)
Pad_e66
  rect 0.299x1.27 smd: 18(0,0)
Pad_e67
  rect 0.299x1.25 smd: 17(0,0)
Pad_e68
  rect 0.299x1.25 smd: 16(0,0)
Pad_e69
  rect 0.299x1.25 smd: 15(0,0)
Pad_e70
  rect 0.299x1.25 smd: 14(0,0)
Pad_e71
  rect 0.299x1.25 smd: 13(0,0)
Pad_e72
  rect 0.299x1.27 smd: 12(0,0)
Pad_e73
  rect 0.299x1.25 smd: 11(0,0)
Pad_e74
  rect 0.299x1.27 smd: 10(0,0)
Pad_e75
  rect 0.299x1.27 smd: 9(0,0)
Pad_e76
  rect 0.299x1.27 smd: 8(0,0)
Pad_e77
  rect 0.299x1.25 smd: 7(0,0)
Pad_e78
  rect 0.299x1.27 smd: 6(0,0)
Pad_e79
  rect 0.299x1.27 smd: 5(0,0)
Pad_e80
  rect 0.299x1.25 smd: 4(0,0)
Pad_e81
  rect 0.299x1.27 smd: 3(0,0)
Pad_e82
  rect 0.299x1.27 smd: 2(0,0)
Pad_e83
  rect 0.299x1.27 smd: 1(0,0)
Pad_e149
  oval 1.8x0.254 smd: 64(0,0)
Pad_e150
  oval 1.8x0.254 smd: 63(0,0)
Pad_e151
  oval 1.8x0.254 smd: 62(0,0)
Pad_e152
  oval 1.8x0.254 smd: 61(0,0)
Pad_e153
  oval 1.8x0.254 smd: 60(0,0)
Pad_e154
  oval 1.8x0.254 smd: 59(0,0)
Pad_e155
  oval 1.8x0.254 smd: 58(0,0)
Pad_e156
  oval 1.8x0.254 smd: 57(0,0)
Pad_e157
  oval 1.8x0.254 smd: 56(0,0)
Pad_e158
  oval 1.8x0.254 smd: 55(0,0)
Pad_e159
  oval 1.8x0.254 smd: 54(0,0)
Pad_e160
  oval 1.8x0.254 smd: 53(0,0)
Pad_e161
  oval 1.8x0.254 smd: 52(0,0)
Pad_e162
  oval 1.8x0.254 smd: 51(0,0)
Pad_e163
  oval 1.8x0.254 smd: 50(0,0)
Pad_e164
  oval 1.8x0.254 smd: 49(0,0)
Pad_e165
  oval 0.254x1.8 smd: 48(0,0)
Pad_e166
  oval 0.254x1.8 smd: 47(0,0)
Pad_e167
  oval 0.254x1.8 smd: 46(0,0)
Pad_e168
  oval 0.254x1.8 smd: 45(0,0)
Pad_e169
  oval 0.254x1.8 smd: 44(0,0)
Pad_e170
  oval 0.254x1.8 smd: 43(0,0)
Pad_e171
  oval 0.254x1.8 smd: 42(0,0)
Pad_e172
  oval 0.254x1.8 smd: 41(0,0)
Pad_e173
  oval 0.254x1.8 smd: 40(0,0)
Pad_e174
  oval 0.254x1.8 smd: 39(0,0)
Pad_e175
  oval 0.254x1.8 smd: 38(0,0)
Pad_e176
  oval 0.254x1.8 smd: 37(0,0)
Pad_e177
  oval 0.254x1.8 smd: 36(0,0)
Pad_e178
  oval 0.254x1.8 smd: 35(0,0)
Pad_e179
  oval 0.254x1.8 smd: 34(0,0)
Pad_e180
  oval 0.254x1.8 smd: 33(0,0)
Pad_e181
  oval 1.8x0.254 smd: 32(0,0)
Pad_e182
  oval 1.8x0.254 smd: 31(0,0)
Pad_e183
  oval 1.8x0.254 smd: 30(0,0)
Pad_e184
  oval 1.8x0.254 smd: 29(0,0)
Pad_e185
  oval 1.8x0.254 smd: 28(0,0)
Pad_e186
  oval 1.8x0.254 smd: 27(0,0)
Pad_e187
  oval 1.8x0.254 smd: 26(0,0)
Pad_e188
  oval 1.8x0.254 smd: 25(0,0)
Pad_e189
  oval 1.8x0.254 smd: 24(0,0)
Pad_e190
  oval 1.8x0.254 smd: 23(0,0)
Pad_e191
  oval 1.8x0.254 smd: 22(0,0)
Pad_e192
  oval 1.8x0.254 smd: 21(0,0)
Pad_e193
  oval 1.8x0.254 smd: 20(0,0)
Pad_e194
  oval 1.8x0.254 smd: 19(0,0)
Pad_e195
  oval 1.8x0.254 smd: 18(0,0)
Pad_e196
  oval 1.8x0.254 smd: 17(0,0)
Pad_e197
  oval 0.254x1.8 smd: 16(0,0)
Pad_e198
  oval 0.254x1.8 smd: 15(0,0)
Pad_e199
  oval 0.254x1.8 smd: 14(0,0)
Pad_e200
  oval 0.254x1.8 smd: 13(0,0)
Pad_e201
  oval 0.254x1.8 smd: 12(0,0)
Pad_e202
  oval 0.254x1.8 smd: 11(0,0)
Pad_e203
  oval 0.254x1.8 smd: 10(0,0)
Pad_e204
  oval 0.254x1.8 smd: 9(0,0)
Pad_e205
  oval 0.254x1.8 smd: 8(0,0)
Pad_e206
  oval 0.254x1.8 smd: 7(0,0)
Pad_e207
  oval 0.254x1.8 smd: 6(0,0)
Pad_e208
  oval 0.254x1.8 smd: 5(0,0)
Pad_e209
  oval 0.254x1.8 smd: 4(0,0)
Pad_e210
  oval 0.254x1.8 smd: 3(0,0)
Pad_e211
  oval 0.254x1.8 smd: 2(0,0)
Pad_e212
  oval 0.254x1.8 smd: 1(0,0)
R0402
  rect 0.566x0.54 smd: 1(-0.433,0) 2(0.433,0)
RES-ARRAY-SMD_0402-8P-L2.0-W1.0-BL
  rect 0.3x0.505 smd: 1(-0.75,0.427) 2(-0.25,0.427) 3(0.25,0.427) 4(0.75,0.427) 5(0.75,-0.427) 6(0.25,-0.427) 7(-0.25,-0.427) 8(-0.75,-0.427)
TQFP-64_L10.0-W10.0-P0.50-LS12.0-BL
  oval 0.254x1.8 smd: 1(-3.75,-5.55) 2(-3.25,-5.55) 3(-2.75,-5.55) 4(-2.25,-5.55) 5(-1.75,-5.55) 6(-1.25,-5.55) 7(-0.75,-5.55) 8(-0.25,-5.55) 9(0.25,-5.55) 10(0.75,-5.55) 11(1.25,-5.55) 12(1.75,-5.55) 13(2.25,-5.55) 14(2.75,-5.55) 15(3.25,-5.55) 16(3.75,-5.55) 33(3.75,5.55) 34(3.25,5.55) 35(2.75,5.55) 36(2.25,5.55) 37(1.75,5.55) 38(1.25,5.55) 39(0.75,5.55) 40(0.25,5.55) 41(-0.25,5.55) 42(-0.75,5.55) 43(-1.25,5.55) 44(-1.75,5.55) 45(-2.25,5.55) 46(-2.75,5.55) 47(-3.25,5.55) 48(-3.75,5.55)
  oval 1.8x0.254 smd: 17(5.55,-3.75) 18(5.55,-3.25) 19(5.55,-2.75) 20(5.55,-2.25) 21(5.55,-1.75) 22(5.55,-1.25) 23(5.55,-0.75) 24(5.55,-0.25) 25(5.55,0.25) 26(5.55,0.75) 27(5.55,1.25) 28(5.55,1.75) 29(5.55,2.25) 30(5.55,2.75) 31(5.55,3.25) 32(5.55,3.75) 49(-5.55,3.75) 50(-5.55,3.25) 51(-5.55,2.75) 52(-5.55,2.25) 53(-5.55,1.75) 54(-5.55,1.25) 55(-5.55,0.75) 56(-5.55,0.25) 57(-5.55,-0.25) 58(-5.55,-0.75) 59(-5.55,-1.25) 60(-5.55,-1.75) 61(-5.55,-2.25) 62(-5.55,-2.75) 63(-5.55,-3.25) 64(-5.55,-3.75)
WSON-12_L3.0-W2.0-P0.50-BL-EP
  rect 0.28x0.5 smd: 1(-1.25,-0.94) 2(-0.75,-0.94) 3(-0.25,-0.94) 4(0.25,-0.94) 5(0.75,-0.94) 6(1.25,-0.94) 7(1.25,0.94) 8(0.75,0.94) 9(0.25,0.94) 10(-0.25,0.94) 11(-0.75,0.94) 12(-1.25,0.94)
  custom 3.4x0.9 smd: 13(0,0)

## Nets
As in the schematic.

Pads without a net: NOREF 13; NOREF#2 32; NOREF#3 17; NOREF#4 1; NOREF#5 2; NOREF#6 6; NOREF#7 25; NOREF#8 30; NOREF#9 4; NOREF#10 25; NOREF#11 19; NOREF#12 43; NOREF#13 37; NOREF#14 2; NOREF#15 17; NOREF#16 2; NOREF#17 18; NOREF#18 39; NOREF#19 11; NOREF#20 12; NOREF#21 5; NOREF#22 2; NOREF#23 1; NOREF#24 2; NOREF#25 1; NOREF#26 2; NOREF#27 16; NOREF#28 20; NOREF#29 3; NOREF#30 2; NOREF#31 1; NOREF#32 54; NOREF#33 10; NOREF#34 1; NOREF#35 2; NOREF#36 2; NOREF#37 2; NOREF#38 1; NOREF#39 61; NOREF#40 2; NOREF#41 47; NOREF#42 1; NOREF#43 23; NOREF#44 1; NOREF#45 33; NOREF#46 1; NOREF#47 16; NOREF#48 6; NOREF#49 38; NOREF#50 33; NOREF#51 2; NOREF#52 26; NOREF#53 64; NOREF#54 22; NOREF#55 47; NOREF#56 25; NOREF#57 2; NOREF#58 29; NOREF#59 2; NOREF#60 9; NOREF#61 10; NOREF#62 1; NOREF#63 23; NOREF#64 8; NOREF#65 36; NOREF#66 1; NOREF#67 1; NOREF#68 2; NOREF#69 4; NOREF#70 4; NOREF#71 59; NOREF#72 53; NOREF#73 57; NOREF#74 26; NOREF#75 46; NOREF#76 30; NOREF#77 28; NOREF#78 61; NOREF#79 22; NOREF#80 2; NOREF#81 1; NOREF#82 32; NOREF#83 20; NOREF#84 4; NOREF#85 15; NOREF#86 1; NOREF#87 32; NOREF#88 27; NOREF#89 12; NOREF#90 3; NOREF#91 2; NOREF#92 2; NOREF#93 24; NOREF#94 31; NOREF#95 21; NOREF#96 14; NOREF#97 59; NOREF#98 1; NOREF#99 17; NOREF#100 1; NOREF#101 9; NOREF#102 18; NOREF#103 15; NOREF#104 42; NOREF#105 8; NOREF#106 49; NOREF#107 9; NOREF#108 28; NOREF#109 58; NOREF#110 1; NOREF#111 19; NOREF#112 21; NOREF#113 30; NOREF#114 1; NOREF#115 2; NOREF#116 12; NOREF#117 40; NOREF#118 2; NOREF#119 2; NOREF#120 6; NOREF#121 10; NOREF#122 2; NOREF#123 8; NOREF#124 7; NOREF#125 2; NOREF#126 2; NOREF#127 56; NOREF#128 64; NOREF#129 15; NOREF#130 35; NOREF#131 29; NOREF#132 20; NOREF#133 2; NOREF#134 1; NOREF#135 56; NOREF#136 44; NOREF#137 2; NOREF#138 29; NOREF#139 31; NOREF#140 1; NOREF#141 41; NOREF#142 14; NOREF#143 58; NOREF#144 27; NOREF#145 44; NOREF#146 10; NOREF#147 13; NOREF#148 1; NOREF#149 28; NOREF#150 1; NOREF#151 12; NOREF#152 2; NOREF#153 14; NOREF#154 51; NOREF#155 50; NOREF#156 1; NOREF#157 2; NOREF#158 48; NOREF#159 3; NOREF#160 27; NOREF#161 22; NOREF#162 24; NOREF#163 34; NOREF#164 11; NOREF#165 20; NOREF#166 52; NOREF#167 1; NOREF#168 39; NOREF#169 2; NOREF#170 45; NOREF#171 51; NOREF#172 6; NOREF#173 34; NOREF#174 3; NOREF#175 26; NOREF#176 57; NOREF#177 2; NOREF#178 48; NOREF#179 1; NOREF#180 5; NOREF#181 42; NOREF#182 19; NOREF#183 4; NOREF#184 24; NOREF#185 32; NOREF#186 2; NOREF#187 23; NOREF#188 3; NOREF#189 2; NOREF#190 19; NOREF#191 28; NOREF#192 11; NOREF#193 1; NOREF#194 22; NOREF#195 2; NOREF#196 37; NOREF#197 29; NOREF#198 50; NOREF#199 13; NOREF#200 2; NOREF#201 2; NOREF#202 18; NOREF#203 35; NOREF#204 21; NOREF#205 13; NOREF#206 1; NOREF#207 45; NOREF#208 24; NOREF#209 60; NOREF#210 23; NOREF#211 31; NOREF#212 1; NOREF#213 38; NOREF#214 1; NOREF#215 5; NOREF#216 1; NOREF#217 54; NOREF#218 2; NOREF#219 27; NOREF#220 46; NOREF#221 62; NOREF#222 17; NOREF#223 15; NOREF#224 63; NOREF#225 1; NOREF#226 55; NOREF#227 62; NOREF#228 18; NOREF#229 5; NOREF#230 41; NOREF#231 1; NOREF#232 2; NOREF#233 40; NOREF#234 1; NOREF#235 2; NOREF#236 16; NOREF#237 1; NOREF#238 7; NOREF#239 14; NOREF#240 60; NOREF#241 7; NOREF#242 11; NOREF#243 36; NOREF#244 1; NOREF#245 25; NOREF#246 31; NOREF#247 26; NOREF#248 55; NOREF#249 49; NOREF#250 1; NOREF#251 21; NOREF#252 1; NOREF#253 43; NOREF#254 1; NOREF#255 9; NOREF#256 53; NOREF#257 52; NOREF#258 8; NOREF#259 63; NOREF#260 7; NOREF#261 16; NOREF#262 30; SCREW1 1; SCREW2 1; SCREW3 1; SCREW4 1; U1 27 29; U2 27 29

## Via types
v1: diameter 0.4, hole 0.3, Top Layer to Bottom Layer, 140 vias

## Routing (per net, layer and track width the routed paths; a pad name or vN(x,y) marks a point on that pad's centre or on a via; arc(x,y) is an arc through that point)
+2.5V: length 103.7
  Top Layer w0.152: C24.1 v1(30.2,16.17) ; C24.1 C25.1 30.17,18.36 U1.21 28.26,18.33 27.31,18.33 v1(27.06,18.59) 27.33,18.86 U1.22 ; C24.1 30.15,17.36 U1.19 ; 18.55,20.24 18.55,18.97 18.42,18.84 17.21,18.84 U1.59 14.93,18.86 C26.1 C27.1 13.81,18.42 13.61,18.21 13.36,18.21 13.36,18.21 v1(12.96,18.21) ; 18.55,20.24 18.43,20.36 U1.56 ; 18.55,20.24 18.55,21.13 18.32,21.36 U1.54 ; LM1.11 15.23,27.63 15.32,27.53 R6.2
  Top Layer w0.254: 12.12,26.46 v1(13.47,26.46) ; 12.12,26.46 v1(10.93,26.46) ; 12.12,26.46 12.07,26.41 12.07,19.14 12.89,18.32 12.89,18.28 v1(12.96,18.21) ; v1(31.89,18.67) 32.37,18.2 32.37,16.53 32.01,16.17 v1(30.2,16.17)
  Bottom Layer w0.152: 27.16,18.69 v1(27.06,18.59) ; 27.16,18.69 27.33,18.86 U1.22 30.05,18.86 C32.1 C33.1 31.76,18.8 v1(31.89,18.67) ; 27.16,18.69 27.14,18.71 27.14,20.49 27.16,20.51 ; U2.19 16.06,17.36 15.25,16.55 C30.1 ; 16.01,18.23 16.01,18.71 16.16,18.86 U1.59 ; 16.01,18.23 15.48,17.7 C31.1 C30.1 ; 16.01,18.23 16.15,18.36 U2.21 ; U2.54 28.27,21.38 27.29,21.38 27.16,21.25 27.16,20.51 ; U2.56 27.32,20.36 27.16,20.51 ; C30.1 v1(14.78,15.92)
  Bottom Layer w0.254: v1(14.78,15.92) 14.27,15.41 13.47,15.41 12.96,15.92 v1(12.96,18.21)
  Bottom Layer w0.381: v1(10.93,26.46) 10.68,26.71 10.68,33.45 12.27,34.18 30.05,34.18 30.2,34.03 32.52,29.68 32.52,19.31 v1(31.89,18.67)
+3.3V: length 65.3
  Top Layer w0.152: C8.2 14.65,31.28 14.9,31.03 ; LM1.8 13.73,27.73 13.43,27.44 v1(13.38,27.44) ; 14.9,31.03 C9.1 14.73,30.96 LM1.3 ; 14.9,31.03 15.25,31.03 v1(15.38,31.16) ; v1(24.31,32.17) C37.2 24.29,30.76 X1.4 23.61,29.55 ; C22.1 15.76,24.17 15.76,23.79 16.19,23.36 U1.50 ; 19.06,26.86 18.99,26.79 U1.48 ; v1(19.06,26.91) 17.27,26.91 v1(16.14,28.04) ; R_pu1.1 18.88,29.31 v1(18.93,29.25)
  Top Layer w0.254: v1(30.24,24.56) 35.11,24.56 35.47,24.91 v1(35.47,25.54) ; LM1.12 v1(16.14,28.04)
  Bottom Layer w0.152: v1(18.93,29.25) 19.15,29.04 C23.1 19.15,26.94 19.06,26.86 ; 13.17,28.34 13.19,28.35
  Bottom Layer w0.203: U2.48 26.9,25.66 27.28,26.04 C28.1 v1(28.33,26.04) ; v1(30.24,24.56) C29.1 29.64,23.71 29.29,23.36 U2.50
  Bottom Layer w0.254: v1(13.38,27.44) 13.32,27.44 13.17,27.59 13.17,29.79 14.53,31.15 15.37,31.15 ; v1(15.76,24.29) 16.77,25.3 16.77,27.41 v1(16.14,28.04) 16.14,30.4 v1(15.38,31.16)
  Bottom Layer w0.305: v1(15.38,31.16) 15.38,31.79 15.76,32.17 v1(17.03,32.17) v1(24.31,32.17) 27.44,32.17 28.33,31.29 v1(28.33,26.04)
  Bottom Layer w0.381: v1(28.33,26.04) 30.24,26.04 v1(30.24,24.56)
  vias: v1(34.87,25.16)
-2.5V: length 99.9
  Top Layer w0.152: 27.22,19.36 v1(26.72,19.87) 27.21,20.36 U1.25 30.02,20.36 30.11,20.28 ; 27.22,19.36 26.82,19.36 26.63,19.17 26.63,18.01 26.78,17.86 U1.20 ; 27.22,19.36 U1.23 ; v1(28.33,24.56) 28.29,24.52 U1.32 ; v1(31.76,21.38) C12.2 31.16,22.52 ; 30.24,20.28 C3.1 v1(31.76,20.28) ; v1(31.76,23.67) C13.2 31.16,22.52 ; 31.16,22.52 v1(31.76,22.52) ; U1.57 15.63,19.86 15.42,19.64 ; 15.42,19.64 C26.2 C27.2 13.13,19.64 v1(13.09,19.6) ; 15.42,19.64 15.7,19.36 U1.58 ; U1.53 14.93,21.86 14.74,21.67 C20.1 v1(13.09,21.67)
  Top Layer w0.254: v1(31.76,25.19) 28.97,25.19 v1(28.33,24.56)
  Bottom Layer w0.152: U1.23 29.28,19.36 29.56,19.64 ; 13.94,21.89 C16.2 13.94,23.5 14.3,23.86 U2.32 ; 13.94,21.89 C15.2 v1(13.09,20.75) ; 13.94,21.89 13.31,21.89 v1(13.09,21.67) ; U2.25 18.17,20.36 18.32,20.21 18.32,19.48 ; U2.53 29.38,21.86 29.56,21.67 C18.1 C19.1 31.47,21.67 v1(31.76,21.38) ; 18.32,19.47 18.3,19.47 18.18,19.36 U1.58 16.15,19.36 15.59,18.8 14.87,18.8 C5.1 v1(13.09,18.8) ; 18.32,19.47 18.32,19.75 ; 18.32,19.47 18.32,18.1 18.08,17.86 U2.20 ; v1(31.75,19.64) C33.2 C32.2 29.56,19.64 ; U2.57 29.34,19.86 29.56,19.64
  Bottom Layer w0.254: v1(13.09,21.67) v1(13.09,20.75) v1(13.09,19.6) v1(13.09,18.8)
  Bottom Layer w0.381: v1(13.09,21.67) 13.09,21.83 11.69,23.23 v1(11.69,28.24) 11.69,30.94 11.92,31.31 15.74,32.66 24.37,32.74 28.57,32.66 29.77,31.24 31.72,25.69 v1(31.76,25.19) v1(31.76,23.67) v1(31.76,22.52) v1(31.76,21.38) v1(31.76,20.28) 31.76,19.65 v1(31.75,19.64)
AGND: length 92.4
  Top Layer w0.152: R1.1 v1(10.93,20.11) ; C71.1 16.57,11.8 v1(16.57,13) ; v1(14.48,28.98) 14.48,29.01 14.23,29.26 LM1.4 14.23,30.28 13.81,30.69 13.81,32.23 13.56,32.23 13.54,32.21 12.84,32.21 ; C58.1 26.55,11.98 v1(26.83,12.26) 27.08,12.51 C57.1 ; 10.1,29.47 10.37,29.75 10.37,30.03 ; 19.98,12.33 20.01,12.33 ; 19.98,12.33 19.7,12.33 19.48,12.1 ; 19.98,12.33 20.08,12.24 C67.1 ; 19.98,12.33 v1(19.95,12.36) ; v1(18.21,7.6) 18.23,7.58 18.23,5.39 v1(18.22,5.38) ; 28.29,23.36 29.29,23.36 29.47,23.54 v1(29.47,24.56) ; v1(25.74,5.38) 25.74,6.53 25.73,6.53 25.73,7.57 v1(25.76,7.6) ; v1(31.89,17.06) 31.63,17.32 C24.2 ; 17.73,12.23 17.76,12.21 17.76,12.21 ; v1(21.24,7.6) 21.23,7.59 21.23,5.42 v1(21.19,5.38) ; v1(27.24,5.38) 27.23,5.38 27.23,7.58 v1(27.26,7.6) ; v1(19.7,7.6) 19.73,7.57 19.73,5.42 v1(19.69,5.38) ; 10.73,28.82 10.21,28.82 10.14,28.76 ; 23.76,12.6 23.83,12.52 v1(23.83,12.11) ; v1(22.74,5.38) 22.73,5.38 22.73,7.58 v1(22.71,7.6) ; C25.2 31.51,18.33 v1(31.89,17.95) ; v1(24.23,7.6) 24.23,7.6 24.23,6.53 24.24,6.52 v1(24.24,5.38) ; 17.76,12.21 v1(17.79,12.24) ; 17.76,12.21 17.54,11.98 C70.1 ; 17.76,12.21 18.24,12.21 ; 16.73,6.53 16.73,7.74 v1(16.93,7.93) ; v1(15.76,5.38) 15.73,5.41 15.73,6.53 15.72,6.55 v1(15.72,7.52) ; v1(14.73,7.54) 14.73,5.39 v1(14.74,5.38) ; v1(22.49,11.73) 22.6,11.62 C63.1 22.84,11.72 22.84,12.62 22.57,12.89 C64.1 ; 28.85,12.94 28.86,12.93 28.86,12.64 28.7,12.48 28.36,12.48 ; C65.1 21.43,12.93 v1(21.25,12.93) 21.09,12.78 C66.1 ; C123.2 v1(15,14.78) ; U1.62 18.22,17.36 v1(18.68,17.82) 18.14,18.36 U1.60 ; C59.1 25.54,12.24 v1(25.41,12.36) 25.39,12.34 C60.1
  Bottom Layer w0.152: C67.1 20.08,12.24 v1(19.95,12.36) 19.69,12.36 ; v1(16.57,13) 16.52,12.95 C71.1 ; 27.25,7.6 27.25,5.4 v1(27.24,5.38) ; 18.23,5.38 v1(18.22,5.38) ; 18.23,5.38 18.23,7.59 ; 18.23,5.38 18.25,5.41 18.25,7.56 18.23,7.59 ; v1(13.94,15.92) C30.2 C31.2 ; v1(17.41,25.32) 17.41,24.92 18.32,24.01 18.32,23.56 18.12,23.36 17.19,23.36 ; 23.76,12.6 23.83,12.52 v1(23.83,12.11) 23.83,11.8 23.76,11.73 ; 22.84,11.62 22.84,12.62 22.84,12.62 22.71,12.76 ; C124.2 v1(28.88,12.97) 28.88,12.66 28.71,12.49 28.35,12.49 C55.1 ; v1(21.25,12.93) 21.09,12.78 C66.1 ; U2.62 v1(26.93,17.36) 26.93,17.82 27.47,18.36 U2.60 ; 19.73,7.58 v1(19.7,7.6) ; 19.73,7.58 19.73,5.41 ; 19.73,7.58 19.75,7.55 19.75,5.44 19.73,5.41 ; 18.3,12.24 v1(17.79,12.24) 17.54,11.98 C70.1 ; v1(25.74,5.38) 25.75,5.39 25.75,7.6 v1(25.76,7.6) ; 19.67,12.36 C96.1 ; 22.71,12.76 22.62,12.76 ; 22.71,12.76 22.57,12.89 C64.1 ; 19.73,5.41 v1(19.69,5.38) ; 18.23,7.59 v1(18.21,7.6) ; C104.1 25.39,12.38 v1(25.41,12.36) 25.54,12.24 C59.1 ; v1(22.74,5.38) 22.75,5.4 22.75,7.56 v1(22.71,7.6) ; v1(24.24,5.38) 24.25,5.39 24.25,7.57 v1(24.23,7.6) ; C57.1 27.08,12.51 v1(26.83,12.26) 26.55,11.98 C58.1 ; v1(30.74,5.38) 30.75,5.4 30.75,7.6 ; 29.75,6.53 29.75,5.4 v1(29.74,5.38) ; C63.1 22.6,11.62 v1(22.49,11.73) ; v1(28.58,7.66) 28.75,7.49 28.75,6.53 ; v1(21.24,7.6) 21.25,7.59 21.25,6.53 21.19,6.47 v1(21.19,5.38)
  vias: v1(10.14,29.51) v1(10.14,28.75) v1(11.44,4.44) v1(11.44,3.77) v1(11.44,3.01) v1(11.44,2.25) v1(11.6,20.75) v1(13.47,25.32) v1(13.67,28.98) v1(15.27,28.98) v1(29.34,4.49) v1(29.34,3.82) v1(29.34,3.06) v1(29.34,2.3) v1(30.76,7.6)
